# Altium schematic sheet Connector_Section.SchDoc
size A; DocumentNumber: 8; SheetNumber: 8; SheetTotal: 8
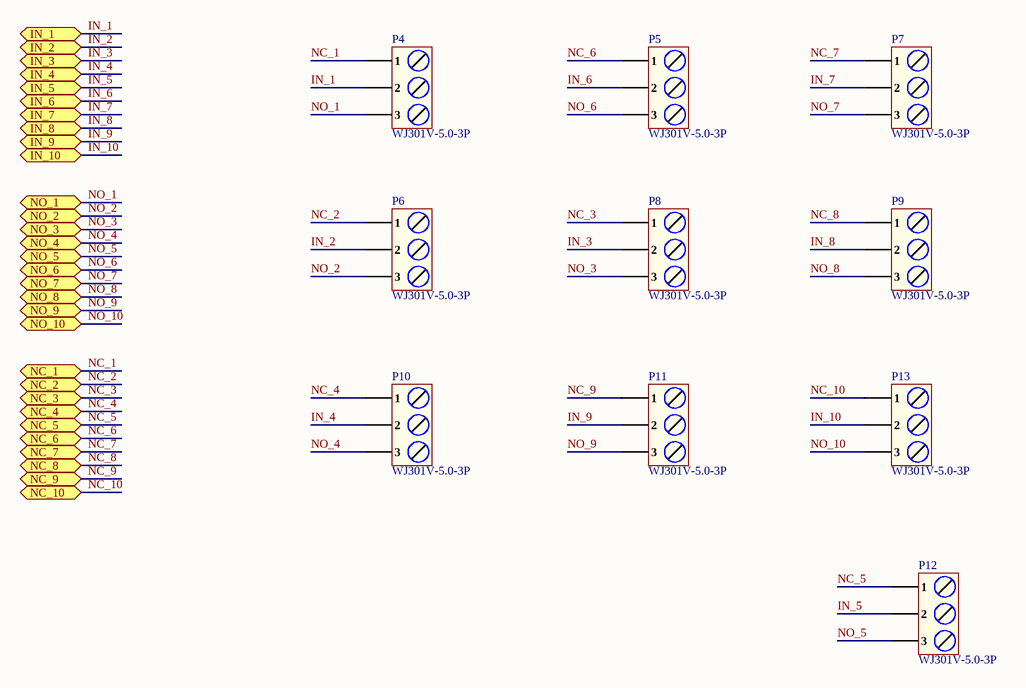
[diagram p0: Connector_Section.SchDoc]

## Parts
P4  WJ301V-5.0-3P  [WJ301V-5.0-3P]
P5  WJ301V-5.0-3P  [WJ301V-5.0-3P]
P6  WJ301V-5.0-3P  [WJ301V-5.0-3P]
P7  WJ301V-5.0-3P  [WJ301V-5.0-3P]
P8  WJ301V-5.0-3P  [WJ301V-5.0-3P]
P9  WJ301V-5.0-3P  [WJ301V-5.0-3P]
P10  WJ301V-5.0-3P  [WJ301V-5.0-3P]
P11  WJ301V-5.0-3P  [WJ301V-5.0-3P]
P12  WJ301V-5.0-3P  [WJ301V-5.0-3P]
P13  WJ301V-5.0-3P  [WJ301V-5.0-3P]

## Ports
IN_1 (bidir), IN_2 (bidir), IN_3 (bidir), IN_4 (bidir), IN_5 (bidir), IN_6 (bidir), IN_7 (bidir), IN_8 (bidir), IN_9 (bidir), IN_10 (bidir), NC_1 (bidir), NC_2 (bidir), NC_3 (bidir), NC_4 (bidir), NC_5 (bidir), NC_6 (bidir), NC_7 (bidir), NC_8 (bidir), NC_9 (bidir), NC_10 (bidir), NO_1 (bidir), NO_2 (bidir), NO_3 (bidir), NO_4 (bidir), NO_5 (bidir), NO_6 (bidir), NO_7 (bidir), NO_8 (bidir), NO_9 (bidir), NO_10 (bidir)

## Nets
IN_1: P4.2 ; port IN_1
IN_2: P6.2 ; port IN_2
IN_3: P8.2 ; port IN_3
IN_4: P10.2 ; port IN_4
IN_5: P12.2 ; port IN_5
IN_6: P5.2 ; port IN_6
IN_7: P7.2 ; port IN_7
IN_8: P9.2 ; port IN_8
IN_9: P11.2 ; port IN_9
IN_10: P13.2 ; port IN_10
NC_1: P4.1 ; port NC_1
NC_2: P6.1 ; port NC_2
NC_3: P8.1 ; port NC_3
NC_4: P10.1 ; port NC_4
NC_5: P12.1 ; port NC_5
NC_6: P5.1 ; port NC_6
NC_7: P7.1 ; port NC_7
NC_8: P9.1 ; port NC_8
NC_9: P11.1 ; port NC_9
NC_10: P13.1 ; port NC_10
NO_1: P4.3 ; port NO_1
NO_2: P6.3 ; port NO_2
NO_3: P8.3 ; port NO_3
NO_4: P10.3 ; port NO_4
NO_5: P12.3 ; port NO_5
NO_6: P5.3 ; port NO_6
NO_7: P7.3 ; port NO_7
NO_8: P9.3 ; port NO_8
NO_9: P11.3 ; port NO_9
NO_10: P13.3 ; port NO_10

## Library data of the parts
P4-P13 = WJ301V-5.0-3P: P=5.0mm Screw terminal RoHS; Manufacturer: Ningbo Kangnex Elec; Item Type: Terminal Block; Manufacturer Part Number: WJ301V-5.0-3P; Package: Custom; LCSC Part Number: C8483; ComponentLink1Description: LCSC; ComponentLink1URL: https://www.lcsc.com/product-detail/Screw-terminal_Ningbo-Kangnex-Elec-WJ301V-5-0-3P_C8483.html